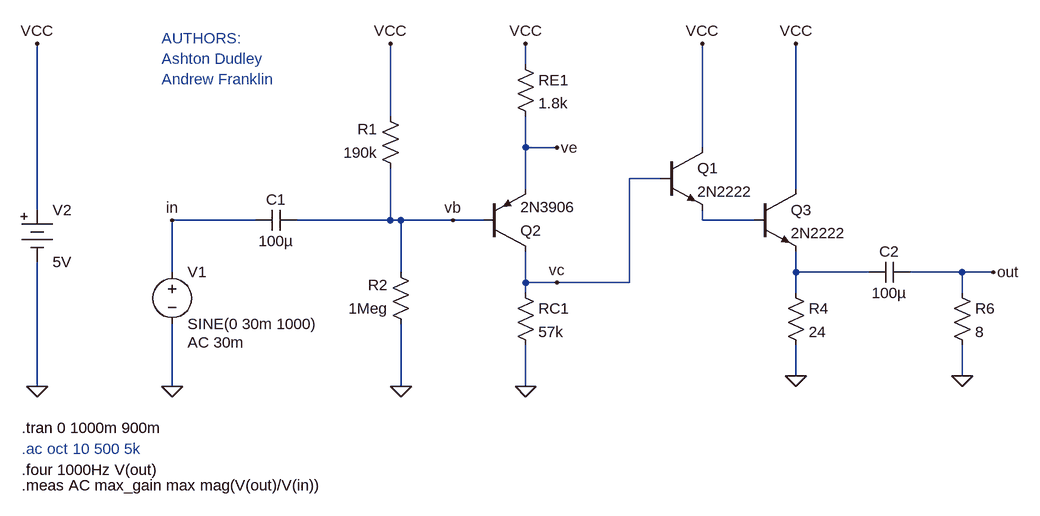
[diagram p0: schematic Lab 5 Amplifer V1.asc]
Lab 5 Amplifer V1.asc, the LTspice schematic file:
Version 4.1
SHEET 1 984 720
WIRE 208 -112 208 -144
WIRE 0 -32 0 -144
WIRE 208 16 208 -32
WIRE 256 16 208 16
WIRE 480 16 480 -144
WIRE 416 64 368 64
WIRE 208 80 208 16
WIRE 624 80 624 -144
WIRE -544 112 -544 -144
WIRE -208 128 -336 128
WIRE 0 128 0 48
WIRE 0 128 -144 128
WIRE 16 128 0 128
WIRE 96 128 16 128
WIRE 144 128 96 128
WIRE 480 128 480 112
WIRE 560 128 480 128
WIRE -336 208 -336 128
WIRE 16 208 16 128
WIRE 624 208 624 176
WIRE 736 208 624 208
WIRE 880 208 800 208
WIRE 928 208 880 208
WIRE 208 224 208 176
WIRE 256 224 208 224
WIRE 368 224 368 64
WIRE 368 224 256 224
WIRE 208 240 208 224
WIRE 624 240 624 208
WIRE 880 240 880 208
WIRE 624 368 624 320
WIRE 880 368 880 320
WIRE -544 384 -544 192
WIRE -336 384 -336 288
WIRE 16 384 16 288
WIRE 208 384 208 320
FLAG 16 384 0
FLAG -336 128 in
FLAG -336 384 0
FLAG 208 384 0
FLAG -544 384 0
FLAG 256 224 vc
FLAG 256 16 ve
FLAG 96 128 vb
FLAG 0 -144 VCC
FLAG 208 -144 VCC
FLAG -544 -144 VCC
FLAG 480 -144 VCC
FLAG 624 -144 VCC
FLAG 624 368 0
FLAG 880 368 0
FLAG 928 208 out
SYMBOL npn 416 16 R0
SYMATTR InstName Q1
SYMATTR Value 2N2222
SYMBOL res 16 64 R180
WINDOW 0 36 76 Left 2
WINDOW 3 36 40 Left 2
SYMATTR InstName R1
SYMATTR Value 190k
SYMBOL res 32 304 R180
WINDOW 0 36 76 Left 2
WINDOW 3 36 40 Left 2
SYMATTR InstName R2
SYMATTR Value 1Meg
SYMBOL voltage -336 192 R0
WINDOW 123 24 124 Left 2
WINDOW 39 0 0 Left 0
SYMATTR Value2 AC 30m
SYMATTR InstName V1
SYMATTR Value SINE(0 30m 1000)
SYMBOL Misc\\battery -544 96 R0
WINDOW 123 0 0 Left 0
WINDOW 39 0 0 Left 0
SYMATTR InstName V2
SYMATTR Value 5V
SYMBOL cap -144 112 R90
WINDOW 0 0 32 VBottom 2
WINDOW 3 32 32 VTop 2
SYMATTR InstName C1
SYMATTR Value 100µ
SYMBOL res 192 -128 R0
SYMATTR InstName RE1
SYMATTR Value 1.8k
SYMBOL res 192 224 R0
SYMATTR InstName RC1
SYMATTR Value 57k
SYMBOL pnp 144 176 M180
SYMATTR InstName Q2
SYMATTR Value 2N3906
SYMBOL npn 560 80 R0
SYMATTR InstName Q3
SYMATTR Value 2N2222
SYMBOL res 608 224 R0
SYMATTR InstName R4
SYMATTR Value 24
SYMBOL cap 800 192 R90
WINDOW 0 0 32 VBottom 2
WINDOW 3 32 32 VTop 2
SYMATTR InstName C2
SYMATTR Value 100µ
SYMBOL res 864 224 R0
SYMATTR InstName R6
SYMATTR Value 8
TEXT -568 448 Left 2 !.tran 0 1000m 900m
TEXT -568 480 Left 2 ;.ac oct 10 500 5k
TEXT -568 512 Left 2 !.four 1000Hz V(out)
TEXT -352 -152 Left 2 ;AUTHORS:\nAshton Dudley\nAndrew Franklin
TEXT -568 536 Left 2 !.meas AC max_gain max mag(V(out)/V(in))

The netlist it stands for:
* Lab 5 Amplifer V1.asc
Q1 VCC vc N001 0 2N2222
R1 vb VCC 190k
R2 0 vb 1Meg
V1 in 0 SINE(0 30m 1000) AC 30m
V2 VCC 0 5V
C1 vb in 100µ
RE1 VCC ve 1.8k
RC1 vc 0 57k
Q2 vc vb ve 0 2N3906
Q3 VCC N001 N002 0 2N2222
R4 N002 0 24
C2 out N002 100µ
R6 out 0 8
.model NPN NPN
.model PNP PNP
.lib standard.bjt
.tran 0 1000m 900m
* .ac oct 10 500 5k
.four 1000Hz V(out)
* AUTHORS:
* Ashton Dudley
* Andrew Franklin
.meas AC max_gain max mag(V(out)/V(in))
.backanno
.end